# Altium schematic sheet pca20072_sensors.SchDoc: nRF54L15 Tag - Sensors
size A4; Organization: Nordic Semiconductor; DocumentNumber: 4; SheetNumber: 4; SheetTotal: 5; CompanyName: Nordic Semiconductor; DocumentSize: A4
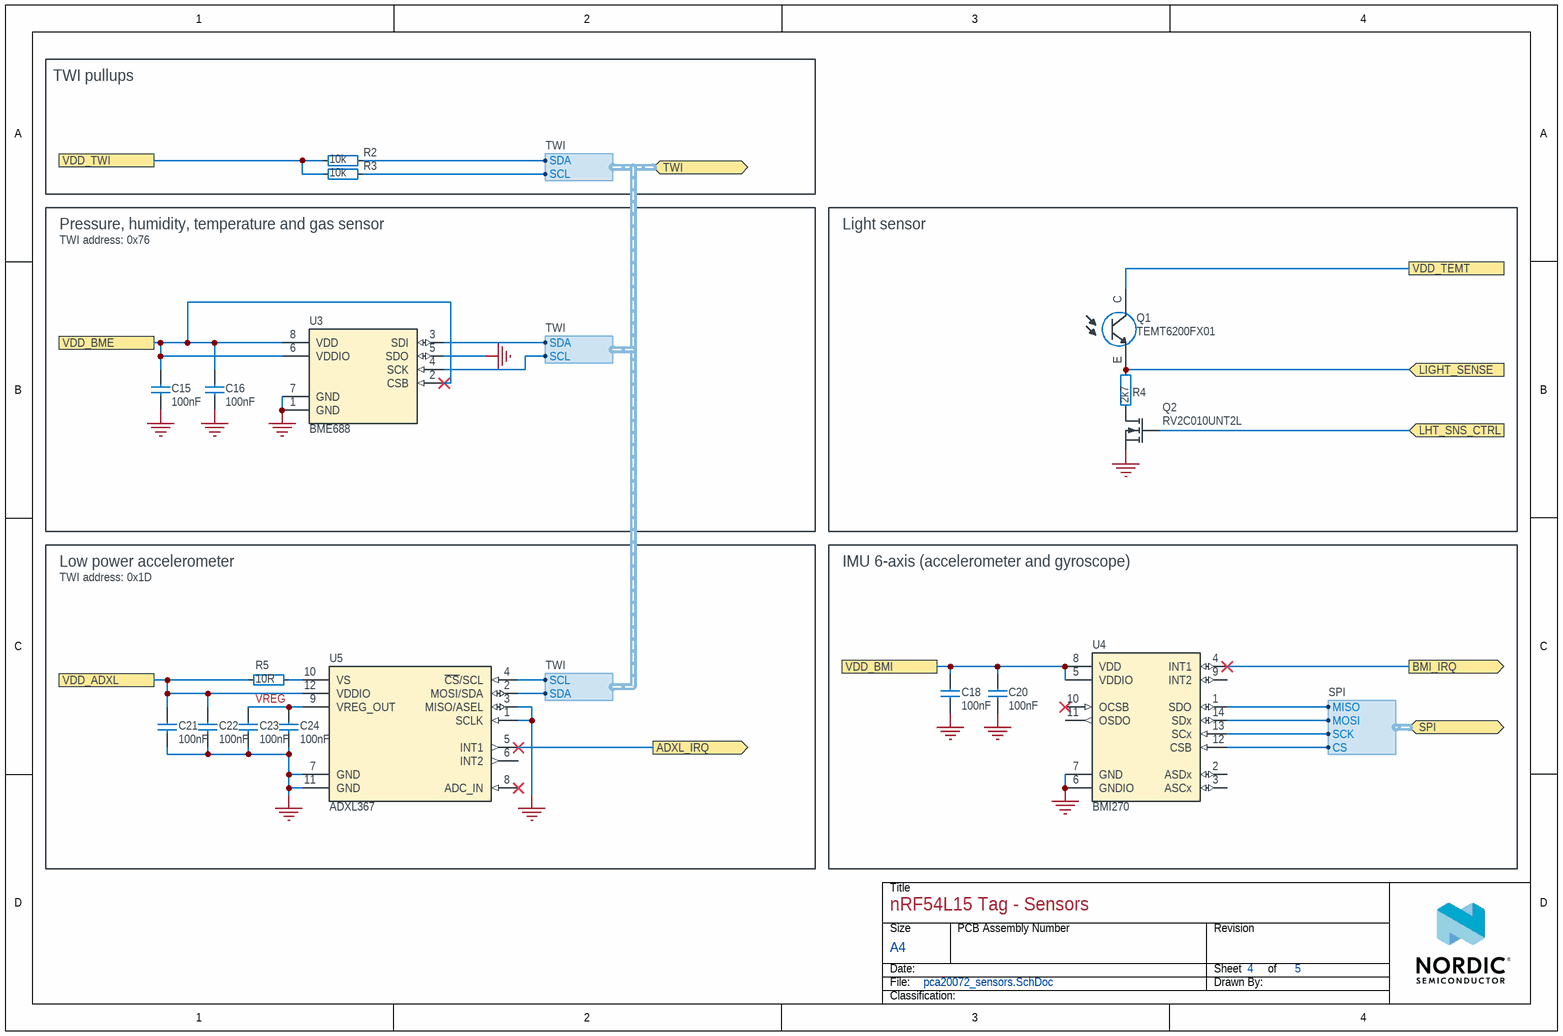
[diagram p0: pca20072_sensors.SchDoc]

## Parts
C15  100nF  [CAPC0603X03L_C]
C16  100nF  [CAPC0603X03L_C]
C18  100nF  [CAPC0603X03L_C]
C20  100nF  [CAPC0603X03L_C]
C21  100nF  [CAPC0603X03L_C]
C22  100nF  [CAPC0603X03L_C]
C23  100nF  [CAPC0603X03L_C]
C24  100nF  [CAPC0603X03L_C]
Q1  TEMT6200FX01  [TEMT6200FX01]
Q2  RV2C010UNT2L  [DFN65P100X40-3L]
R2  10k  [RESC0603X03L_C]
R3  10k  [RESC0603X03L_C]
R4  2k7  [RESC0603X03L_C]
R5  10R  [RESC0603X03L_C]
U3  BME688  [BME680]
U4  BMI270  [BMI270]
U5  ADXL367  [LGA50P220X230X97-12N]

## Blocks framed on the sheet
TWI pullups: R2 R3
Pressure, humidity, temperature and gas sensor: C15 C16 U3
Light sensor: Q1 Q2 R4
Low power accelerometer: C21-C24 R5 U5
IMU 6-axis (accelerometer and gyroscope): C18 C20 U4

## Ports
ADXL_IRQ (out), BMI_IRQ (out), LHT_SNS_CTRL (in), LIGHT_SENSE (in), SPI (bidir, harness SPI), TWI (bidir, harness TWI), VDD_ADXL, VDD_BME, VDD_BMI, VDD_TEMT, VDD_TWI

## Harnesses
TWI: SCL, SDA
SPI: MISO, MOSI, SCK, CS

## Nets
GND: C15.1 C16.1 C18.1 C20.1 C21.1 C22.1 C23.1 C24.1 Q2.2(S) U3.1(GND) U3.5(SDO) U3.7(GND) U4.6(GNDIO) U4.7(GND) U5.1(SCLK) U5.3(MISO/ASEL) U5.7(GND) U5.11(GND)
ADXL_IRQ: U5.5(INT1) ; port ADXL_IRQ
BMI_IRQ: U4.4(INT1) ; port BMI_IRQ
LHT_SNS_CTRL: Q2.1(G) ; port LHT_SNS_CTRL
LIGHT_SENSE: Q1.E R4.2 ; port LIGHT_SENSE
VDD_ADXL: C21.2 C22.2 R5.1 U5.12(VDDIO) ; port VDD_ADXL
VDD_BME: C15.2 C16.2 U3.2(CSB) U3.6(VDDIO) U3.8(VDD) ; port VDD_BME
VDD_BMI: C18.2 C20.2 U4.5(VDDIO) U4.8(VDD) ; port VDD_BMI
VDD_TEMT: Q1.C ; port VDD_TEMT
VDD_TWI: R2.2 R3.2 ; port VDD_TWI
VREG: C23.2 C24.2 U5.9(VREG_OUT)
NetQ2_3: Q2.3(D) R4.1
NetR2_1: R2.1 U3.3(SDI) U5.2(MOSI/SDA) ; port TWI.SDA
NetR3_1: R3.1 U3.4(SCK) U5.4(~{CS}/SCL) ; port TWI.SCL
NetR5_2: R5.2 U5.10(VS)
NetU4_1: U4.1(SDO) ; port SPI.MISO
NetU4_12: U4.12(CSB) ; port SPI.CS
NetU4_13: U4.13(SCx) ; port SPI.SCK
NetU4_14: U4.14(SDx) ; port SPI.MOSI

Not connected (* = marked no-connect by the designer): U4 2(ASDx) 3(ASCx) 9(INT2) 10(OCSB)* 11(OSDO); U5 6(INT2) 8(ADC_IN)*

## Notes on the sheet
- TWI address: 0x76
- TWI address: 0x1D
- Title
- Size
- Date:
- File:
- A4
- PCB Assembly Number
- Sheet
- Drawn By:
- Revision
- of
- Classification:

## Library data of the parts
C15 C16 C21-C24 = C0201-100n: Capacitor, X5R, ±10%, 100nF, 16V; Manufacturer: N.A.; Part number IPS: 00000001248, 00000002505; Part number Norautron: 262071862; Part number NEMS: 100200078; Component Status: Active; Pad Count: 2; Part Number: C0201-100n; Manufacturer Part Number: N.A.; Footprint Doc: 0201; LatestRevisionDate: 2024-06-27; Published: 2014-11-13; Value: 100nF; Note: 16V; Artikkelnr Noca: N.A.; ComponentLink1URL: N.A.; ComponentLink1Description: Datasheet; ComponentLink2URL: N.A.; ComponentLink2Description: Supplier link; HelpURL: N.A.; Supplier 1: N.A.; Supplier Part Number 1: N.A.; Supplier 2: N.A.; Supplier Part Number 2: N.A.; PartId: 100200078; Component Class: Capacitors; Author: rsk
C18 C20 = C0201-100n: Capacitor, X5R, ±10%, 100nF, 16V; Manufacturer: N.A.; Part number IPS: 00000001248, 00000002505; Part number Norautron: 262071862; Part number NEMS: 100200078; Pad Count: 2; Component Status: Active; Part Number: C0201-100n; Manufacturer Part Number: N.A.; Footprint Doc: 0201; LatestRevisionDate: 2024-06-27; Published: 2014-11-13; Value: 100nF; Note: 16V; Artikkelnr Noca: N.A.; ComponentLink1URL: N.A.; ComponentLink1Description: Datasheet; ComponentLink2URL: N.A.; ComponentLink2Description: Supplier link; HelpURL: N.A.; Supplier 1: N.A.; Supplier Part Number 1: N.A.; Supplier 2: N.A.; Supplier Part Number 2: N.A.; Component Class: Capacitors; PartId: 100200078; Author: rsk
Q1 = TEMT6200FX01: Phototransistors 550nm Top View 0805 (2012 Metric); Manufacturer: Vishay; Part number NEMS: 101400145; Component Status: Active; Pad Count: 2; Note: N.A.; Part Number: TEMT6200FX01; PartId: 101400145; Component Class: Optoelectronics; Author: getr; Manufacturer Part Number: TEMT6200FX01; ComponentLink1URL: https://www.vishay.com/docs/81317/temt6200.pdf; ComponentLink1Description: Datasheet; ComponentLink2URL: https://www.digikey.no/en/products/detail/vishay-semiconductor-opto-division/TEMT6200FX01/1681190?s=N4IgTCBcDaICoFECycBsYAMGBiANDAjAAQgC6AvkA; ComponentLink2Description: Supplier link; HelpURL: https://www.vishay.com/en/product/81317/; LatestRevisionDate: 2023-11-07; Published: 2023-11-07; Footprint Doc: N.A.; Value: TEMT6200FX01; Supplier 1: DigiKey; Supplier Part Number 1: 751-1056-1-ND; Supplier 2: N.A.; Supplier Part Number 2: N.A.; Artikkelnr Noca: N.A.; Part number IPS: N.A.; Part number Norautron: N.A.
Q2 = RV2C010UNT2L: N-Channel MOSFET, 20V, 1A, 470mOhm, 400mW, -55°C ~ 150°C; Manufacturer: Rohm Semiconductor; Part number IPS: 00000009976; Part number Norautron: 26320026; Part number NEMS: 101300132; Component Status: Active; Pad Count: 3; Note: N.A.; Artikkelnr Noca: 35010020; Part Number: RV2C010UNT2L; PartId: 101300132; Component Class: Semiconductors; Author: rsk; Manufacturer Part Number: RV2C010UNT2L; ComponentLink1URL: N.A.; ComponentLink1Description: Datasheet; ComponentLink2URL: N.A.; ComponentLink2Description: Supplier link; HelpURL: http://rohmfs.rohm.com/en/products/databook/datasheet/discrete/transistor/mosfet/rv2c010unt2l-e.pdf; LatestRevisionDate: 2024-09-18; Published: 2016-08-09; Footprint Doc: DFN-3; Value: RV2C010UNT2L; Supplier 1: DigiKey; Supplier Part Number 1: RV2C010UNT2LCT-ND; Supplier 2: Mouser; Supplier Part Number 2: 755-RV2C010UNT2L
R2 R3 = R0201-10k: Resistor, ±1%, 0.05W; Manufacturer: N.A.; Part number IPS: 00000001255; Part number Norautron: 26107101; Part number NEMS: 100100065; Component Status: Active; Pad Count: 2; Note: Chip Res 1%; Part Number: R0201-10k; PartId: 100100065; Component Class: Resistors; Author: rsk; Manufacturer Part Number: N.A.; ComponentLink1URL: N.A.; ComponentLink1Description: Datasheet; ComponentLink2URL: N.A.; ComponentLink2Description: Supplier link; HelpURL: N.A.; LatestRevisionDate: 2014-11-13; Published: 2014-11-13; Footprint Doc: 0201; Value: 10k; Supplier 1: N.A.; Supplier Part Number 1: N.A.; Supplier 2: N.A.; Supplier Part Number 2: N.A.; Artikkelnr Noca: N.A.
R4 = R0201-2k7: Resistor, ±1%, 0.05W; Manufacturer: N.A.; Part number Norautron: 26108481; Part number NEMS: 100100054; Component Status: Active; Pad Count: 2; Note: Chip Res 1%; Part Number: R0201-2k7; PartId: 100100054; Component Class: Resistors; Author: rsk; Manufacturer Part Number: N.A.; ComponentLink1URL: N.A.; ComponentLink1Description: Datasheet; ComponentLink2URL: N.A.; ComponentLink2Description: Supplier link; HelpURL: N.A.; LatestRevisionDate: 2014-11-13; Published: 2014-11-13; Footprint Doc: 0201; Value: 2k7; Supplier 1: N.A.; Supplier Part Number 1: N.A.; Supplier 2: N.A.; Supplier Part Number 2: N.A.; Artikkelnr Noca: N.A.; Part number IPS: N.A.
R5 = R0201-10R: Resistor, ±1%, 0.05W; Manufacturer: N.A.; Part number NEMS: 100100014; Component Status: Active; Pad Count: 2; Note: Chip Res 1%; Part Number: R0201-10R; PartId: 100100014; Component Class: Resistors; Author: rsk; Manufacturer Part Number: N.A.; ComponentLink1URL: N.A.; ComponentLink1Description: Datasheet; ComponentLink2URL: N.A.; ComponentLink2Description: Supplier link; HelpURL: N.A.; LatestRevisionDate: 2014-11-13; Published: 2014-11-13; Footprint Doc: 0201; Value: 10R; Supplier 1: N.A.; Supplier Part Number 1: N.A.; Supplier 2: N.A.; Supplier Part Number 2: N.A.; Artikkelnr Noca: N.A.; Part number IPS: N.A.; Part number Norautron: N.A.
U3 = BME688: Low power gas, pressure, temperature & humidity sensor; Manufacturer: Bosch; Part number NEMS: 101900619; Component Status: Active; Pad Count: 8; Note: N.A.; Part Number: BME688; PartId: 101900619; Component Class: Misc_ICs; Author: rsk; Manufacturer Part Number: BME688; ComponentLink1URL: https://www.bosch-sensortec.com/media/boschsensortec/downloads/datasheets/bst-bme688-ds000.pdf; ComponentLink1Description: Datasheet; ComponentLink2Description: Supplier link; HelpURL: https://www.bosch-sensortec.com/products/environmental-sensors/gas-sensors/bme688/; LatestRevisionDate: 2024-10-03; Published: 2020-07-07; Footprint Doc: LGA-8; Value: BME688; Supplier 1: DigiKey; Supplier Part Number 1: 828-BME688TR-ND; Supplier 2: N.A.; Supplier Part Number 2: N.A.; Artikkelnr Noca: N.A.; Part number IPS: N.A.; Part number Norautron: N.A.
U4 = BMI270: 6-axis, smart, low-power, inertial measurement unit; Manufacturer: Bosch; Part number NEMS: 101900620; Note: N.A.; Pad Count: 14; Component Status: Active; Part Number: BMI270; Manufacturer Part Number: BMI270; ComponentLink1URL: https://www.bosch-sensortec.com/media/boschsensortec/downloads/datasheets/bst-bmi270-ds000.pdf; ComponentLink1Description: Datasheet; ComponentLink2URL: https://www.bosch-sensortec.com/products/motion-sensors/imus/bmi270.html; ComponentLink2Description: Supplier link; HelpURL: https://www.bosch-sensortec.com/media/boschsensortec/downloads/datasheets/bst-bmi270-ds000.pdf; Footprint Doc: LGA-14; LatestRevisionDate: 2021-08-03; Published: 2020-07-07; Value: BMI270; Supplier 1: DigiKey; Supplier Part Number 1: 828-1091-1-ND; Supplier 2: Mouser; Supplier Part Number 2: 262-BMI270; Artikkelnr Noca: N.A.; Part number IPS: N.A.; Component Class: Misc_ICs; PartId: 101900620; Author: rsk; Part number Norautron: N.A.
U5 = ADXL367BCCZ: Micropower, 3-Axis, ±2 g/±4 g/±8 g Digital Output MEMS Accelerometer; Manufacturer: Analog Devices; Part number NEMS: 101900775; Note: N.A.; Component Status: Active; Pad Count: 12; Part Number: ADXL367BCCZ; Manufacturer Part Number: ADXL367BCCZ; ComponentLink1URL: http://www.analog.com/media/en/technical-documentation/data-sheets/ADXL367.pdf; ComponentLink1Description: Datasheet; ComponentLink2URL: https://www.digikey.com/en/products/detail/analog-devices-inc/ADXL367BCCZ-RL7/16360579; ComponentLink2Description: Supplier link; HelpURL: http://www.analog.com/en/products/ADXL367.html; Footprint Doc: LGA-12; LatestRevisionDate: 2023-04-03; Published: 2023-04-03; Value: ADXL367; Supplier 1: DigiKey; Supplier Part Number 1: 505-ADXL367BCCZ-RL7CT-ND; Supplier 2: Mouser; Supplier Part Number 2: 584-ADXL367BCCZ-RL7; Artikkelnr Noca: N.A.; Part number IPS: N.A.; Component Class: Misc_ICs; Author: rubr; Part number Norautron: N.A.; PartId: 101900775